# Altium schematic sheet Лист 2.SchDoc: Наименование
size 420 x 297 mm; ListNumber: 1; SheetNumber: 2; SheetTotal: 2; PageSetup: Record=PageOptions|CenterHorizontal=True|CenterVertical=True|PrintScale=0.94|XCorrection=1.00|YCorrection=1.00|PrintKind=1|BorderSize=5000000|LeftOffset=0|BottomOffset=0|Orientation=1|PaperLength=1000|PaperWidth=1000|Scale=100|PaperSource=7|PrintQuality=-4|MediaType=1|DitherType=10|PaperKind=A4|PrintScaleMode=1; DecimalNumber: АНГМ.687282.002 Э3; Name: ООО "Амаринго"; DocumentName: Sheet1.SCHDOC
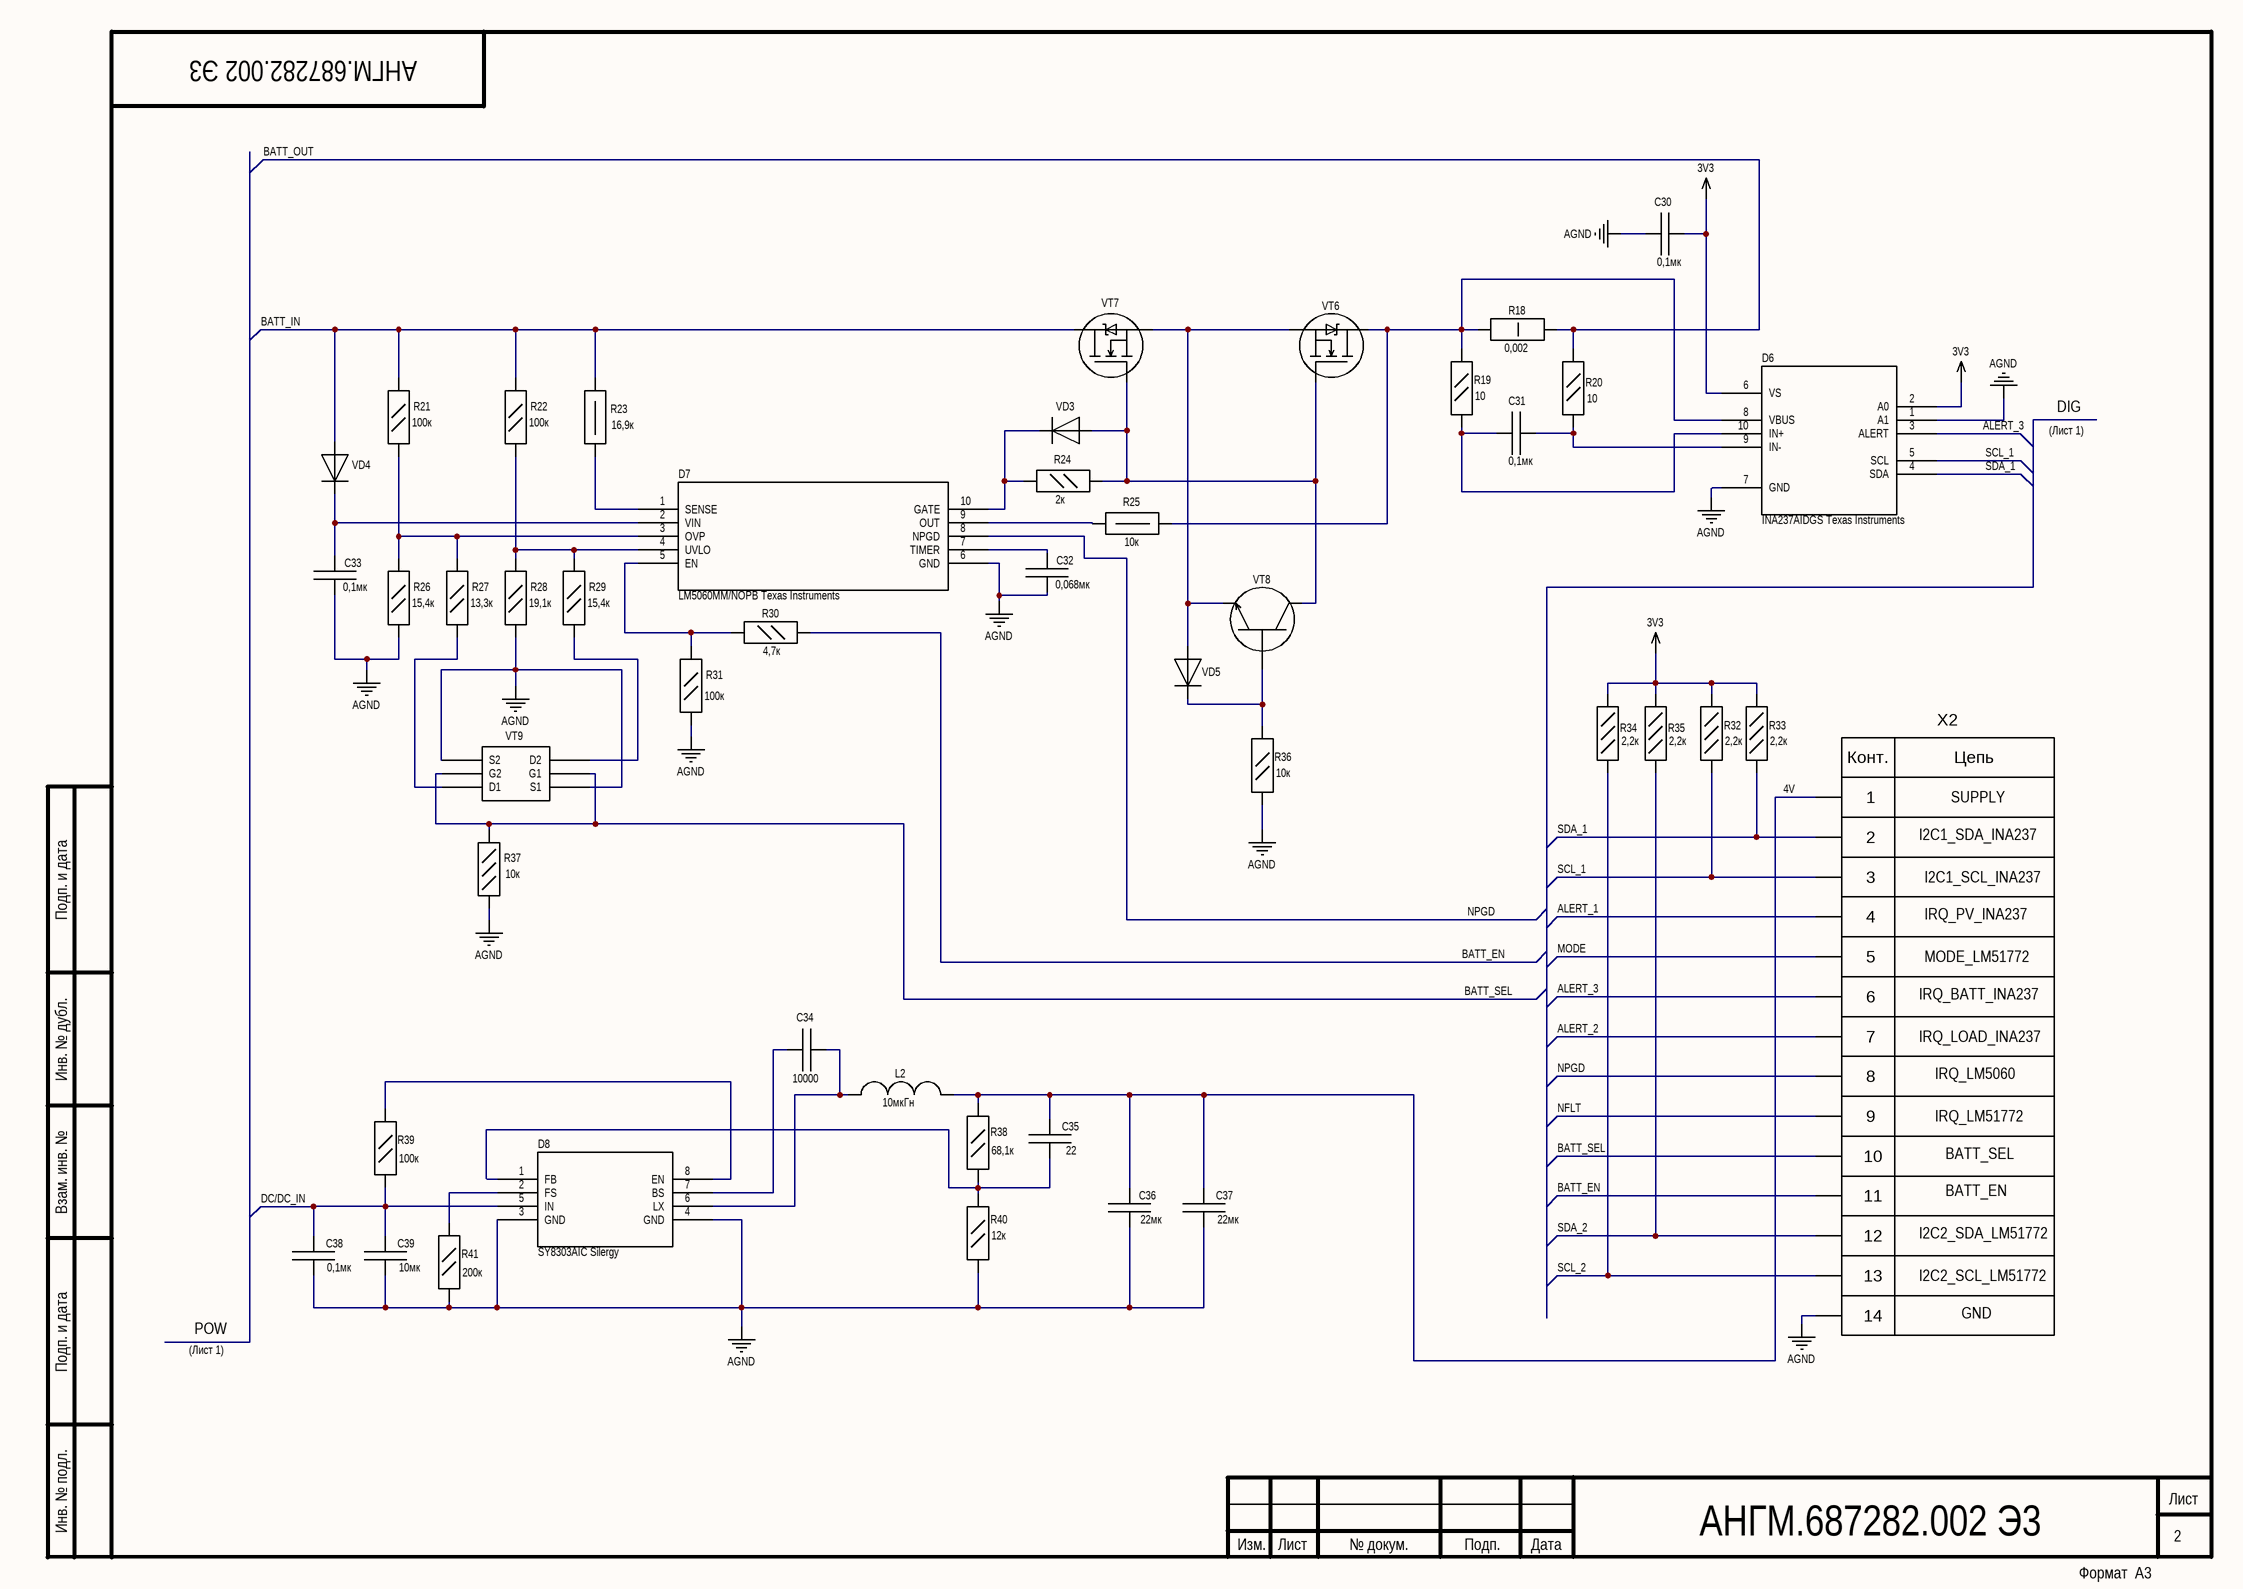
[diagram p0: Лист 2.SchDoc]

## Parts
C30  Capacitence: 0,1мк  [CC0603]  (hidden comment: CL10B104KO8NNNC Samsung Electronics)
C31  Capacitance: 0,1мк  [CC0805]  (hidden comment: CC0805KKX7R0BB104 Yageo)
C32  Capacitence: 0,068мк  [CC0603]  (hidden comment: GRM188R71C683K Murata Electronics)
C33  Capacitence: 0,1мк  [CC0805]  (hidden comment: CC0805KKX7R0BB104 Yageo)
C34  Capacitence: 10000  [CC0603]  (hidden comment: CC0603KRX7R9BB103 Yageo)
C35  Capacitence: 22  [CC0603]  (hidden comment: CC0603JRNPO9BN220 Yageo)
C36  Capacitence: 22мк  [CC1206]  (hidden comment: GRM31CR61C226KE15L Murata Electronics)
C37  Capacitence: 22мк  [CC1206]  (hidden comment: GRM31CR61C226KE15L Murata Electronics)
C38  Capacitence: 0,1мк  [CC0805]  (hidden comment: CC0805KKX7R0BB104 Yageo)
C39  Capacitence: 10мк  [CC1206]  (hidden comment: CL31B106KBHNNNE Samsung Electronics)
D6  INA237AIDGS Texas Instruments  [VSSOP]
D7  LM5060MM/NOPB Texas Instruments  [VSSOP]
D8  SY8303AIC Silergy  [TSOT23-8]
L2  Inductance: 10мкГн  [IHLP2525CZER100M01]  (hidden comment: IHLP2525CZER100M01 Vishay)
R18  Resistance: 0,002  [RC2512]  (hidden comment: RLM25FECR002 TA-I)
R19  Resistance: 10  [RC0805]  (hidden comment: RC0805JR-0710RL Yageo)
R20  Resistance: 10  [RC0805]  (hidden comment: RC0805JR-0710RL Yageo)
R21  Resistance: 100к  [RC0805]  (hidden comment: RC0805FR-07100KL Yageo)
R22  Resistance: 100к  [RC0805]  (hidden comment: RC0805FR-07100KL Yageo)
R23  Resistance: 16,9к  [RC1210]  (hidden comment: RC1210FR-0716K9L Yageo)
R24  Resistance: 2к  [RC0805]  (hidden comment: RC0805JR-072KL Yageo)
R25  Resistance: 10к  [RC1210]  (hidden comment: RC1210JR-0710KL Yageo)
R26  Resistance: 15,4к  [RC0805]  (hidden comment: RC0805FR-0715K4L Yageo)
R27  Resistance: 13,3к  [RC0805]  (hidden comment: RC0805FR-0713K3L Yageo)
R28  Resistance: 19,1к  [RC0805]  (hidden comment: RC0805FR-0719K1L Yageo)
R29  Resistance: 15,4к  [RC0805]  (hidden comment: RC0805FR-0715K4L Yageo)
R30  Resistance: 4,7к  [RC0805]  (hidden comment: RC0805JR-074K7L Yageo)
R31  Resistance: 100к  [RC0805]  (hidden comment: RC0805JR-07100KL Yageo)
R32  Resistance: 2,2к  [RC0603]  (hidden comment: RC0603FR-072K2L Yageo)
R33  Resistance: 2,2к  [RC0603]  (hidden comment: RC0603FR-072K2L Yageo)
R34  Resistance: 2,2к  [RC0603]  (hidden comment: RC0603FR-072K2L Yageo)
R35  Resistance: 2,2к  [RC0603]  (hidden comment: RC0603FR-072K2L Yageo)
R36  Resistance: 10к  [RC0805]  (hidden comment: RC0805JR-0710KL Yageo)
R37  Resistance: 10к  [RC0603]  (hidden comment: RT0603BRD0710KL Yageo)
R38  Resistance: 68,1к  [RC0805]  (hidden comment: RC0805FR-0768K1L Yageo)
R39  Resistance: 100к  [RC0805]  (hidden comment: RC0805JR-07100KL Yageo)
R40  Resistance: 12к  [RC0805]  (hidden comment: RC0805FR-0712KL Yageo)
R41  Resistance: 200к  [RC0805]  (hidden comment: RC0805FR-07200KL Yageo)
VD3  Диод 1N4148W Diotec Semiconductor  [SOD-123F]  (value not drawn)
VD4  Диод 1N4148W Diotec Semiconductor  [SOD-123F]  (value not drawn)
VD5  Диод 1N4148W Diotec Semiconductor  [SOD-123F]  (value not drawn)
VT6  NTMFS5C628NLT1G ON Semiconductor  [DFN5 (SO-8FL)]  (value not drawn)
VT7  NTMFS5C628NLT1G ON Semiconductor  [DFN5 (SO-8FL)]  (value not drawn)
VT8  MMBT5551LT1G ON Semiconductor  [SOT-23-3]  (value not drawn)
VT9  BSS138DW-7-F Diodes Inc  [SOT363]  (value not drawn)
X2  DS1023-2x7 Connfly electronic  [PBD-2x7]  (value not drawn)

## Nets
3V3: C30.1 D6.2(A0) D6.6(VS) R32.2 R33.2 R34.2 R35.2
AGND: C30.2 C32.2 C33.1 C36.2 C37.2 C38.2 C39.2 D6.1(A1) D6.7(GND) D7.6(GND) D8.3(GND) D8.4(GND) R26.2 R28.2 R31.2 R36.2 R37.2 R40.2 R41.1 VT9.1(S1) VT9.4(S2) X2.14
4V: C35.1 C36.1 C37.1 L2.2 R38.1 X2.1
ALERT_1: X2.4
ALERT_2: X2.7
ALERT_3: D6.3(ALERT) X2.6
BATT_EN: R30.2 X2.11
BATT_IN: R21.1 R22.1 R23.1 VD4.1(A) VT7.2(d)
BATT_OUT: R18.2 R20.2
BATT_SEL: R37.1 VT9.2(G1) VT9.5(G2) X2.10
DC/DC_IN: C38.1 C39.1 D8.5(IN) R39.2
MODE: X2.5
NFLT: X2.9
NPGD: D7.8(NPGD) X2.8
SCL_1: D6.5(SCL) R32.1 X2.3
SCL_2: R34.1 X2.13
SDA_1: D6.4(SDA) R33.1 X2.2
SDA_2: R35.1 X2.12
NetC31_1: C31.1 D6.9(IN-) R20.1
NetC31_2: C31.2 D6.10(IN+) R19.1
NetC32_1: C32.1 D7.7(TIMER)
NetC33_2: C33.2 D7.2(VIN) VD4.2(C)
NetC34_1: C34.1 D8.7(BS)
NetC34_2: C34.2 D8.6(LX) L2.1
NetC35_2: C35.2 D8.1(FB) R38.2 R40.1
NetD6_8: D6.8(VBUS) R18.1 R19.2 R25.2 VT6.2(d)
NetD7_1: D7.1(SENSE) R23.2
NetD7_3: D7.3(OVP) R21.2 R26.1 R27.1
NetD7_4: D7.4(UVLO) R22.2 R28.1 R29.1
NetD7_5: D7.5(EN) R30.1 R31.1
NetD7_9: D7.9(OUT) R25.1
NetD7_10: D7.10(GATE) R24.1 VD3.2(C)
NetD8_2: D8.2(FS) R41.2
NetD8_8: D8.8(EN) R39.1
NetR24_2: R24.2 VD3.1(A) VT6.1(g) VT7.1(g) VT8.3(c)
NetR27_2: R27.2 VT9.6(D1)
NetR29_2: R29.2 VT9.3(D2)
NetR36_1: R36.1 VD5.2(C) VT8.1(b)
NetVD5_1: VD5.1(A) VT6.3(s) VT7.3(s) VT8.2(e)

## Notes on the sheet
- (Лист 1)
- DIG
- I2C1_SDA_INA237
- SUPPLY
- I2C1_SCL_INA237
- IRQ_PV_INA237
- IRQ_BATT_INA237
- MODE_LM51772
- IRQ_LOAD_INA237
- IRQ_LM5060
- IRQ_LM51772
- BATT_SEL
- BATT_EN
- I2C2_SDA_LM51772
- POW
- I2C2_SCL_LM51772
- GND
- АНГМ.687282.002 Э3
- Подп. и дата
- Инв. № дубл.
- Взам. инв. №
- Инв. № подл.
- Изм.
- Лист
- № докум.
- Подп.
- Дата
- Формат  A3
- (in symbol X_14) Конт.; Цепь

## Library data of the parts
C30-C33 = C: ComponentKind: Конденсатор
  C30: Наименование: CL10B104KO8NNNC Samsung Electronics; Manufacturer: Samsung Electronics; PartNumber: CL10B104KO8NNNC
  C31 C33: Наименование: CC0805KKX7R0BB104 Yageo; Manufacturer: Yageo; PartNumber: CC0805KKX7R0BB104
  C32: Наименование: GRM188R71C683K Murata Electronics; Manufacturer: Murata Electronics; PartNumber: GRM188R71C683K
C34 C38 = C: Керамический, 50В, 0603; ComponentKind: Конденсатор; Manufacturer: Yageo
  C34: Наименование: CC0603KRX7R9BB103 Yageo; PartNumber: CC0603KRX7R9BB103
  C38: Наименование: CC0805KKX7R0BB104 Yageo; PartNumber: CC0805KKX7R0BB104
C35 = C: Керамический, 16В, NPO (COG), от 16В, 0603,0402.; ComponentKind: Конденсатор; Наименование: CC0603JRNPO9BN220 Yageo; Manufacturer: Yageo; PartNumber: CC0603JRNPO9BN220
C36 C37 = C: Керамический, 16В, 0805; ComponentKind: Конденсатор; Наименование: GRM31CR61C226KE15L Murata Electronics; Manufacturer: Murata Electronics; PartNumber: GRM31CR61C226KE15L
C39 = C: Керамический, 50В, X7R, корпус 1206; ComponentKind: Конденсатор; Наименование: CL31B106KBHNNNE Samsung Electronics; Manufacturer: Samsung Electronics; PartNumber: CL31B106KBHNNNE
D6 = INA237AIDGSR: 85-V, 16-bit, I2C output current/voltage/power monitor with alert 10-VSSOP -40 to 125; Copyright: Copyright (C) 2026 Ultra Librarian. All rights reserved.; Manufacturer_Name: Texas Instruments; Manufacturer_Part_Number: INA237AIDGSR; RefDes: RefDes; Type: Type; ComponentKind: Микросхема; Наименование: INA237AIDGS Texas Instruments; Manufacturer: Texas Instruments; PartNumber: INA237AIDGS
D7 = LM5060MMNOPB: 5.5-V to 65-V high side protection controller 10-VSSOP -40 to 125; Copyright: Copyright (C) 2025 Ultra Librarian. All rights reserved.; Manufacturer_Name: Texas Instruments; Manufacturer_Part_Number: LM5060MM/NOPB; RefDes: RefDes; Type: Type; ComponentKind: Микросхема; Наименование: LM5060MM/NOPB Texas Instruments; Manufacturer: Texas Instruments; PartNumber: LM5060MM/NOPB
D8 = SY8303AIC: Description; Copyright: Copyright (C) 2025 Ultra Librarian. All rights reserved.; Manufacturer_Name: Silergy; Manufacturer_Part_Number: SY8303AIC; RefDes: RefDes; Type: Type; ComponentKind: Микросхема; Наименование: SY8303AIC Silergy; Manufacturer: Silergy; PartNumber: SY8303AIC
L2 = L: ComponentKind: Дроссель; Наименование: IHLP2525CZER100M01 Vishay; Manufacturer: Vishay; PartNumber: IHLP2525CZER100M01
R18 = R_1W: Корпус 2512; Power: 1 Вт; Tolerance: 1%; Value: 2 мОм; ComponentKind: Резистор; Type: RC2512; Наименование: RLM25FECR002 TA-I; Manufacturer: TA-I; PartNumber: RLM25FECR002
R19 R20 = R_0,125W: Корпус 0603; Power: 0,125 Вт; Tolerance: 5%; Value: 10 Ом; ComponentKind: Резистор; Type: RC0805; Наименование: RC0805JR-0710RL Yageo; Manufacturer: Yageo; PartNumber: RC0805JR-0710RL
R21 = R_0,125W: Корпус 0603; Power: 0,125 Вт; Tolerance: 1%; Value: 100 кОм; ComponentKind: Резистор; Type: RC0805; Наименование: RC0805FR-07100KL Yageo; Manufacturer: Yageo; PartNumber: RC0805FR-07100KL
R22 = R_0,125W: Power: 0,125 Вт; Tolerance: 1%; Value: 100 кОм; ComponentKind: Резистор; Type: RC0805; Наименование: RC0805FR-07100KL Yageo; Manufacturer: Yageo; PartNumber: RC0805FR-07100KL
R23 = R_0,5W: Корпус 1206 (1210); Power: 0,5 Вт; Tolerance: 1%; Value: 16,9 кОм; ComponentKind: Резистор; Type: RC1210; Наименование: RC1210FR-0716K9L Yageo; Manufacturer: Yageo; PartNumber: RC1210FR-0716K9L
R24 = R_0,125W: Корпус 0603; Power: 0,125 Вт; Tolerance: 5%; Value: 2 кОм; ComponentKind: Резистор; Type: RC0805; Наименование: RC0805JR-072KL Yageo; Manufacturer: Yageo; PartNumber: RC0805JR-072KL
R25 = R_0,5W: Корпус 1206 (1210); Power: 0,5 Вт; Tolerance: 5%; Value: 10 кОм; ComponentKind: Резистор; Type: RC1210; Наименование: RC1210JR-0710KL Yageo; Manufacturer: Yageo; PartNumber: RC1210JR-0710KL
R26 R29 = R_0,125W: Power: 0,125 Вт; Tolerance: 1%; Value: 15,4 кОм; ComponentKind: Резистор; Type: RC0805; Наименование: RC0805FR-0715K4L Yageo; Manufacturer: Yageo; PartNumber: RC0805FR-0715K4L
R27 = R_0,125W: Power: 0,125 Вт; Tolerance: 1%; Value: 13,3 кОм; ComponentKind: Резистор; Type: RC0805; Наименование: RC0805FR-0713K3L Yageo; Manufacturer: Yageo; PartNumber: RC0805FR-0713K3L
R28 = R_0,125W: Power: 0,125 Вт; Tolerance: 1%; Value: 19,1 кОм; ComponentKind: Резистор; Type: RC0805; Наименование: RC0805FR-0719K1L Yageo; Manufacturer: Yageo; PartNumber: RC0805FR-0719K1L
R30 = R_0,125W: Корпус 0603; Power: 0,125 Вт; Tolerance: 5%; Value: 4,7 кОм; ComponentKind: Резистор; Type: RC0805; Наименование: RC0805JR-074K7L Yageo; Manufacturer: Yageo; PartNumber: RC0805JR-074K7L
R31 = R_0,125W: Power: 0,125 Вт; Tolerance: 5%; Value: 100 кОм; ComponentKind: Резистор; Type: RC0805; Наименование: RC0805JR-07100KL Yageo; Manufacturer: Yageo; PartNumber: RC0805JR-07100KL
R32-R35 = R_0,05W: Power: 0,05 Вт; Tolerance: 5%; Value: 2,2 кОм; ComponentKind: Резистор; Type: RC0201; Наименование: RC0603FR-072K2L Yageo; Manufacturer: Yageo; PartNumber: RC0603FR-072K2L
R36 = R_0,125W: Корпус 0603; Power: 0,125 Вт; Tolerance: 5%; Value: 10 кОм; ComponentKind: Резистор; Type: RC0805; Наименование: RC0805JR-0710KL Yageo; Manufacturer: Yageo; PartNumber: RC0805JR-0710KL
R37 = R_0,05W: Power: 0,05 Вт; Tolerance: 5%; Value: 10 кОм; ComponentKind: Резистор; Type: RC0201; Наименование: RT0603BRD0710KL Yageo; Manufacturer: Yageo; PartNumber: RT0603BRD0710KL
R38 = R_0,125W: Корпус 0603; Power: 0,125 Вт; Tolerance: 1%; Value: 68,1 кОм; ComponentKind: Резистор; Type: RC0805; Наименование: RC0805FR-0768K1L Yageo; Manufacturer: Yageo; PartNumber: RC0805FR-0768K1L
R39 = R_0,125W: Корпус 0603; Power: 0,125 Вт; Tolerance: 5%; Value: 100 кОм; ComponentKind: Резистор; Type: RC0805; Наименование: RC0805JR-07100KL Yageo; Manufacturer: Yageo; PartNumber: RC0805JR-07100KL
R40 = R_0,125W: Корпус 0603; Power: 0,125 Вт; Tolerance: 1%; Value: 12 кОм; ComponentKind: Резистор; Type: RC0805; Наименование: RC0805FR-0712KL Yageo; Manufacturer: Yageo; PartNumber: RC0805FR-0712KL
R41 = R_0,125W: Power: 0,125 Вт; Tolerance: 1%; Value: 200 кОм; ComponentKind: Резистор; Type: RC0805; Наименование: RC0805FR-07200KL Yageo; Manufacturer: Yageo; PartNumber: RC0805FR-07200KL
VD3 VD4 = VD: 1N4148W; ComponentKind: Диод; Наименование: Диод 1N4148W Diotec Semiconductor; Manufacturer: Diotec Semiconductor; PartNumber: 1N4148W
VD5 = VD: ComponentKind: Диод; Наименование: Диод 1N4148W Diotec Semiconductor; Manufacturer: Diotec Semiconductor; PartNumber: 1N4148W
VT6 VT7 = N_GDS: Наименование: Транзистор NTMFS5C628NLT1G ON Semiconductor; ComponentKind: Транзистор; Manufacturer: ON Semiconductor; PartNumber: NTMFS5C628NLT1G
VT8 = NPN_BEC: MMBT5551; Наименование: Транзистор MMBT5551LT1G ON Semiconductor; ComponentKind: Транзистор; Manufacturer: ON Semiconductor; PartNumber: MMBT5551LT1G
VT9 = 2N-MOSFET: Наименование: Транзистор BSS138DW-7-F Diodes Inc; ComponentKind: Транзистор; Manufacturer: Diodes Inc; PartNumber: BSS138DW-7-F
X2 = X_14: ComponentKind: Розетка; Наименование: DS1023-2x7 Connfly electronic; Manufacturer: Connfly electronic; PartNumber: DS1023-2x7